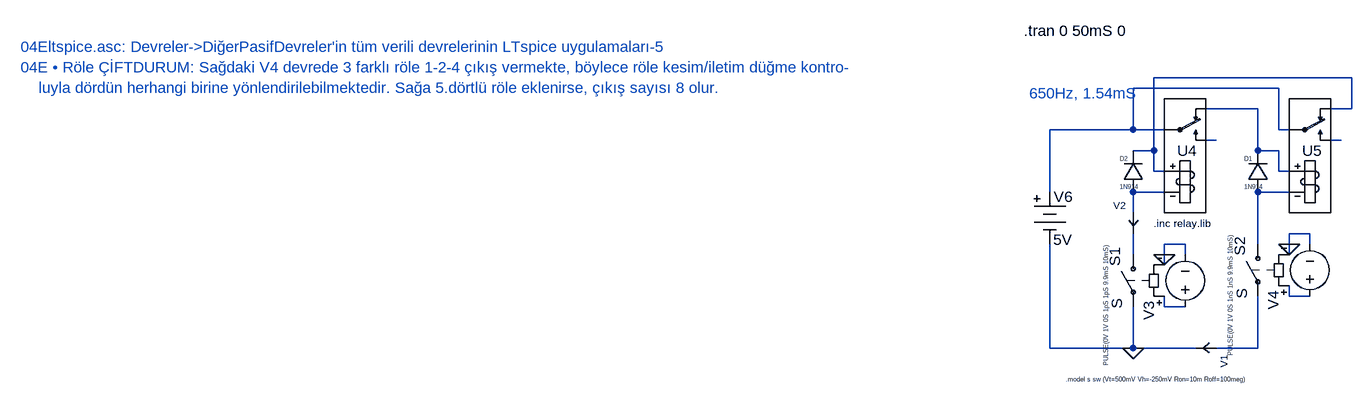
[diagram p0: schematic 04Eltspice.asc]
04Eltspice.asc, the LTspice schematic file:
Version 4
SHEET 1 3332 2492
WIRE 1264 96 960 96
WIRE 1152 112 928 112
WIRE 1120 144 1040 144
WIRE 1264 144 1264 96
WIRE 1264 144 1232 144
WIRE 928 176 928 112
WIRE 928 176 800 176
WIRE 976 176 928 176
WIRE 1152 176 1152 112
WIRE 1168 176 1152 176
WIRE 1056 192 1040 192
WIRE 1248 192 1232 192
WIRE 960 208 960 96
WIRE 960 208 928 208
WIRE 1120 208 1120 144
WIRE 1152 208 1120 208
WIRE 960 240 960 208
WIRE 976 240 960 240
WIRE 1152 240 1152 208
WIRE 1168 240 1152 240
WIRE 800 272 800 176
WIRE 976 272 928 272
WIRE 1168 272 1120 272
WIRE 928 304 928 272
WIRE 1200 336 1168 336
WIRE 1008 352 976 352
WIRE 1120 352 1120 272
WIRE 1168 352 1168 336
WIRE 1200 352 1200 336
WIRE 928 368 928 336
WIRE 976 368 976 352
WIRE 1008 368 1008 352
WIRE 1168 368 1168 352
WIRE 976 384 976 368
WIRE 1168 432 1168 416
WIRE 1200 432 1168 432
WIRE 976 448 976 432
WIRE 1008 448 976 448
WIRE 800 512 800 352
WIRE 928 512 928 448
WIRE 928 512 800 512
WIRE 1024 512 928 512
WIRE 1120 512 1120 432
WIRE 1120 512 1056 512
FLAG 928 512 0
FLAG 976 368 0
FLAG 1168 352 0
SYMBOL Misc\\battery 800 256 R0
WINDOW 0 6 23 Left 2
WINDOW 3 5 89 Left 2
SYMATTR InstName V6
SYMATTR Value 5V
SYMBOL rly_spdt 1008 192 R0
WINDOW 0 -12 16 Left 2
SYMATTR InstName U4
SYMBOL rly_spdt 1200 192 R0
WINDOW 0 -12 16 Left 2
SYMATTR InstName U5
SYMBOL diode 1136 272 R180
WINDOW 0 24 51 Left 0
WINDOW 3 7 8 Left 0
SYMATTR InstName D1
SYMATTR Value 1N914
SYMBOL diode 944 272 R180
WINDOW 0 24 51 Left 0
WINDOW 3 7 8 Left 0
SYMATTR InstName D2
SYMATTR Value 1N914
SYMBOL Ammeter 1072 512 R90
SYMATTR InstName V1
SYMBOL Ammeter 928 288 M0
SYMATTR InstName V2
SYMBOL sw 928 352 M0
WINDOW 0 28 34 VLeft 2
WINDOW 3 25 100 VLeft 2
SYMATTR InstName S1
SYMATTR Value S
SYMBOL voltage 1008 464 M180
WINDOW 0 -56 -5 VRight 2
WINDOW 3 -122 -76 VRight 0
WINDOW 123 0 0 Left 0
WINDOW 39 0 0 Left 0
SYMATTR InstName V3
SYMATTR Value PULSE(0V 1V 0S 1pS 1pS 9.9mS 10mS)
SYMBOL sw 1120 336 M0
WINDOW 0 28 34 VLeft 2
WINDOW 3 25 100 VLeft 2
SYMATTR InstName S2
SYMATTR Value S
SYMBOL voltage 1200 448 M180
WINDOW 0 -56 -5 VRight 2
WINDOW 3 -122 -76 VRight 0
WINDOW 123 0 0 Left 0
WINDOW 39 0 0 Left 0
SYMATTR InstName V4
SYMATTR Value PULSE(0V 1V 0S 1nS 1nS 9.9mS 10mS)
TEXT -784 48 Left 2 ;04Eltspice.asc: Devreler->DiğerPasifDevreler'in tüm verili devrelerinin LTspice uygulamaları-5
TEXT -784 80 Left 2 ;04E • Röle ÇİFTDURUM: Sağdaki V4 devrede 3 farklı röle 1-2-4 çıkış vermekte, böylece röle kesim/iletim düğme kontro-\n    luyla dördün herhangi birine yönlendirilebilmektedir. Sağa 5.dörtlü röle eklenirse, çıkış sayısı 8 olur.
TEXT 760 24 Left 2 !.tran 0 50mS 0
TEXT 960 320 Left 1 !.inc relay.lib
TEXT 824 560 Left 0 !.model s sw (Vt=500mV Vh=-250mV Ron=10m Roff=100meg)
TEXT 768 120 Left 2 ;650Hz, 1.54mS

The netlist it stands for:
* 04Eltspice.asc
V6 N002 0 5V
XU4 N001 N006 N002 N004 N003 RLY_SPDT0  ; pins L+ L- SIN SON SOFF
XU5 N003 N007 N002 N005 N001 RLY_SPDT0  ; pins L+ L- SIN SON SOFF
D1 N007 N003 1N914
D2 N006 N001 1N914
V1 N011 0 0
V2 N006 N008 0
S1 N008 0 N010 0 S
V3 N010 0 PULSE(0V 1V 0S 1pS 1pS 9.9mS 10mS)
S2 N007 N011 N009 0 S
V4 N009 0 PULSE(0V 1V 0S 1nS 1nS 9.9mS 10mS)
.model D D
.lib standard.dio
* 04Eltspice.asc: Devreler->DiğerPasifDevreler'in tüm verili devrelerinin LTspice uygulamaları-5
* 04E • Röle ÇİFTDURUM: Sağdaki V4 devrede 3 farklı röle 1-2-4 çıkış vermekte, böylece röle kesim/iletim düğme kontro-
*     luyla dördün herhangi birine yönlendirilebilmektedir. Sağa 5.dörtlü röle eklenirse, çıkış sayısı 8 olur.
.tran 0 50mS 0
.inc relay.lib
.model s sw (Vt=500mV Vh=-250mV Ron=10m Roff=100meg)
* 650Hz, 1.54mS
.lib relay.lib
.backanno
.end